# Altium schematic sheet MSD-1-A.SchDoc
size A; SheetNumber: 5; SheetTotal: 7
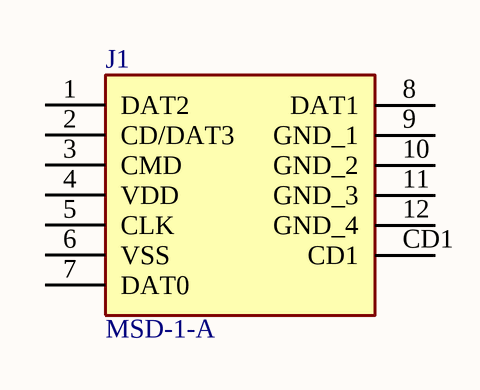
[diagram p0: MSD-1-A.SchDoc]

## Parts
J1  MSD-1-A  [MSD1A]

## Nets

Not connected (* = marked no-connect by the designer): J1 1(DAT2) 2(CD/DAT3) 3(CMD) 4(VDD) 5(CLK) 6(VSS) 7(DAT0) 8(DAT1) 9(GND_1) 10(GND_2) 11(GND_3) 12(GND_4) CD1

## Library data of the parts
J1 = MSD-1-A: Connector; Manufacturer_Name: Same Sky; Datasheet Link: https://www.sameskydevices.com/product/resource/msd-1-a.pdf; Height: 2mm; Manufacturer_Part_Number: MSD-1-A; Mouser Part Number: 179-MSD-1-A; Mouser Price/Stock: https://www.mouser.co.uk/ProductDetail/Same-Sky/MSD-1-A?qs=Z%252BL2brAPG1Ip18XLC4tUPQ%3D%3D; Arrow Part Number: MSD-1-A; Arrow Price/Stock: https://www.arrow.com/en/products/msd-1-a/cui-devices?utm_currency=USD&region=nac